# Altium schematic sheet USB & Power.SchDoc
size A; SheetNumber: 2; SheetTotal: 3
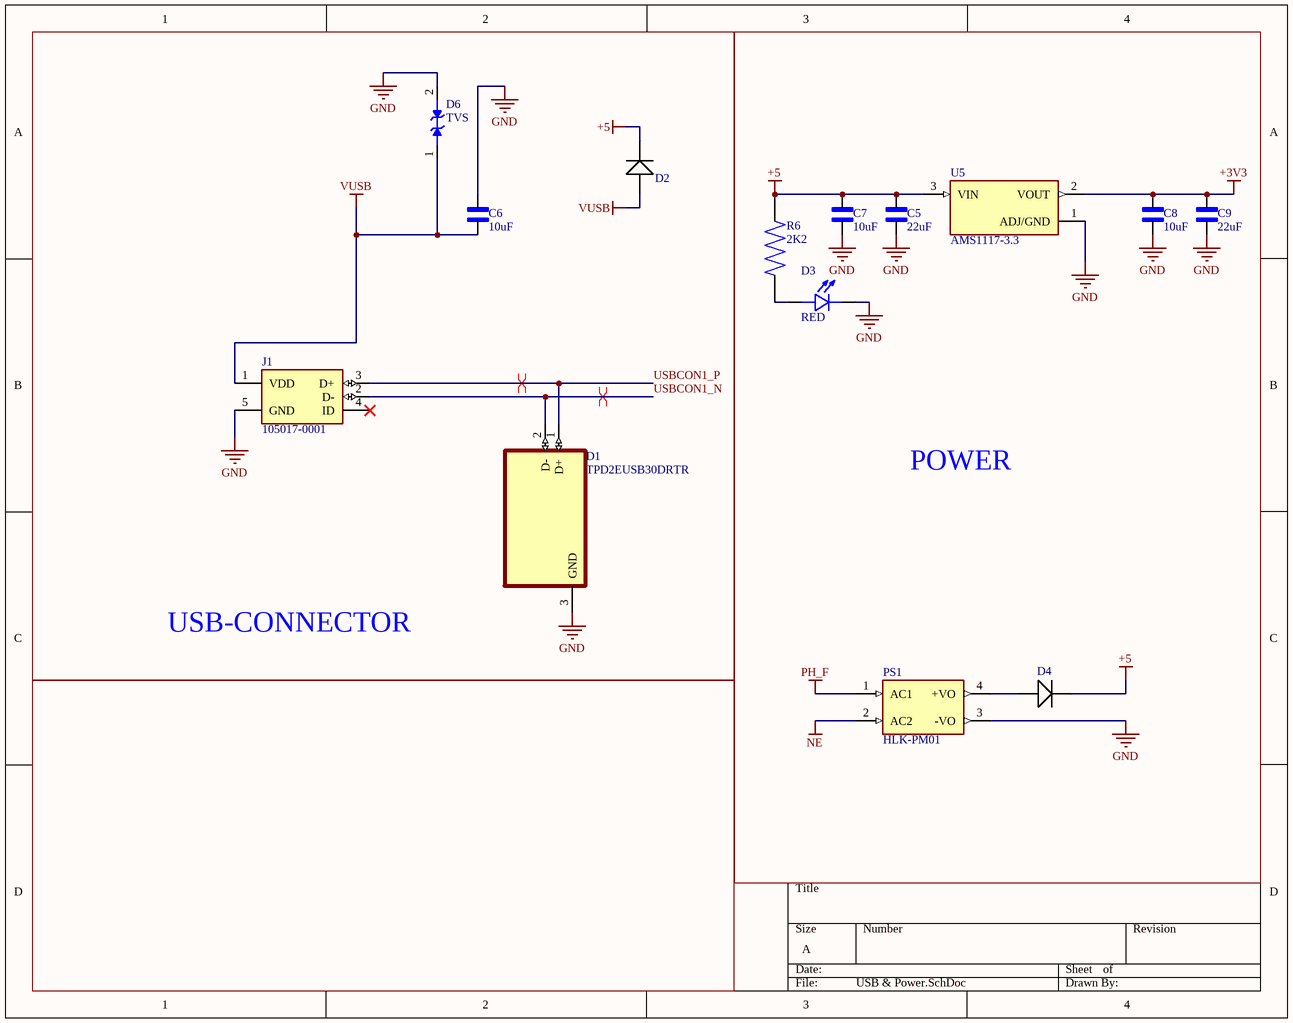
[diagram p0: USB & Power.SchDoc]

## Parts
C5  22uF  [CAPC1608X90]
C6  10uF  [CAPC1608X100N]
C7  10uF  [CAPC1608X100N]
C8  10uF  [CAPC1608X100N]
C9  22uF  [CAPC1608X90]
D1  TPD2EUSB30DRTR  [SOTFL35P100X50-3N]
D2  Panasonic DB2J20900L Schottky Diode, 0.5A, 20V, 2.4ns, 2-Pin SMini2 F5 B  [DIOM1712X07N]  (value not drawn)
D3  RED  [LED_APHHS1005LSECK/J3-PF]
D4  Panasonic DB2J20900L Schottky Diode, 0.5A, 20V, 2.4ns, 2-Pin SMini2 F5 B  [DIOM1712X07N]  (value not drawn)
D6  TVS  [DIO_TPD1E05U06DPYR]
J1  105017-0001  [MOLEX_105017-0001]
PS1  HLK-PM01  [CONV_HLK-PM01]
R6  2K2  [RESC1005X35N]
U5  AMS1117-3.3  [SOT229P700X180-4N]

## Blocks framed on the sheet
USB-CONNECTOR: C6 D1 D2 D6 J1
POWER: C5 C7-C9 D3 D4 PS1 R6 U5

## Nets
+3V3: C8.2 C9.1 U5.2(VOUT)
+5: C5.1 C7.2 D2.1 D4.1 R6.2 U5.3(VIN)
GND: C5.2 C6.2 C7.1 C8.1 C9.2 D1.3(GND) D3.1(C) D6.2(A1) J1.5(GND) PS1.3(-VO) U5.1(ADJ/GND)
NE: PS1.2(AC2)
PH_F: PS1.1(AC1)
VUSB: C6.1 D2.2 D6.1(A) J1.1(VDD)
USBCON1_N: D1.2(D-) J1.2(D-)
USBCON1_P: D1.1(D+) J1.3(D+)
NetD3_2: D3.2(A) R6.1
NetD4_2: D4.2 PS1.4(+VO)

Not connected (* = marked no-connect by the designer): J1 4(ID)*

## Layout directives
differential pair; differential pair class DIFF90: USBCON1_N, USBCON1_P

## Library data of the parts
C5 C9 = CC0603MRX5R6BB226: 22 ÂµF Â±20% 10V Ceramic Capacitor X5R 0603 (1608 Metric); MF: Yageo; SnapEDA_Link: https://www.snapeda.com/parts/CC0603MRX5R6BB226/Yageo/view-part/?ref=snap; Package: 0603 Yageo; Value: *; MP: CC0603MRX5R6BB226; Check_prices: https://www.snapeda.com/parts/CC0603MRX5R6BB226/Yageo/view-part/?ref=eda
C6-C8 = C1608X5R1E106M080AC: 10 ÂµF Â±20% 25V Ceramic Capacitor X5R 0603 (1608 Metric); MF: TDK Corporation; SnapEDA_Link: https://www.snapeda.com/parts/C1608X5R1E106M080AC/TDK/view-part/?ref=snap; Package: 1608-2 TDK; Value: *; MP: C1608X5R1E106M080AC; Check_prices: https://www.snapeda.com/parts/C1608X5R1E106M080AC/TDK/view-part/?ref=eda
D1 = TPD2EUSB30DRTR: 2-channel ESD solution for SuperSpeed USB 3.0 interface 3-SOT-9X3 -40 to 85; MF: Texas Instruments; Package: SOT-9X3-3 Texas Instruments; Purchase-URL: https://pricing.snapeda.com/search/part/TPD2EUSB30DRTR/?ref=eda; Value: *; MP: TPD2EUSB30DRTR; Availability: Warning; SnapEDA_Link: https://www.snapeda.com/parts/TPD2EUSB30DRTR/Texas%20Instruments/view-part/189118/?ref=snap; Price: None
D2 D4 = Schottky Diode, 0.5A, 20V, 2.4ns, 2-Pin SMini2 F5 B: Created By: R Kanjee; Date Created: 1 March 2015; Manufacturer: Panasonic; RS Stock No.: 713-2703; Manufacturer Part No.: DB2J20900L; Datasheet: http://docs-europe.electrocomponents.com/webdocs/1398/0900766b813986b3.pdf; Maximum Continuous Forward Current: 0.5A; Peak Reverse Repetitive Voltage: 20V
D3 = APHHS1005LSECK/J3-PF: Red 625nm LED Indication - Discrete 1.8V 0402 (1005 Metric); MF: Kingbright; SnapEDA_Link: https://www.snapeda.com/parts/APHHS1005LSECK/J3-PF/Kingbright/view-part/?ref=snap; Package: 0402 Kingbright Corporation; Value: *; MP: APHHS1005LSECK/J3-PF; Check_prices: https://www.snapeda.com/parts/APHHS1005LSECK/J3-PF/Kingbright/view-part/?ref=eda
D6 = TPD1E10B06DPYT: Single-channel ESD in 0402 package with 10pF capacitance and 6-V breakdown 2-X1SON -40 to 125; MF: Texas Instruments; Value: *; Package: X1SON-2 Texas Instruments; Purchase-URL: https://pricing.snapeda.com/search/part/TPD1E10B06DPYT/?ref=eda; SnapEDA_Link: https://www.snapeda.com/parts/TPD1E10B06DPYT/Texas%20Instruments/view-part/231963/?ref=snap; Digi-Key_Part_Number: 296-41842-1-ND; Check_prices: https://www.snapeda.com/parts/TPD1E10B06DPYT/Texas%20Instruments/view-part/231963/?ref=eda; MP: TPD1E10B06DPYT
J1 = 105017-0001: ÐŸÐ¾Ð´ÐºÐ».; Ð¿ÐµÑ€ÐµÐ´Ð°Ñ‡Ð° Ð´Ð°Ð½Ð½Ñ‹Ñ…; USB; Ð¿Ñ€Ð¸ÐµÐ¼; Micro; Ñ‚Ð¸Ð¿ B; Ð½Ð¸Ð¶Ð½ÐµÐµ ÐºÑ€ÐµÐ¿Ð»ÐµÐ½Ð¸Ðµ, SMT, Ñ Ð¿Ñ€Ð¸Ð¿Ð¾ÐµÐ¼, Ð±ÐµÐ· ÑÐ²Ð¸Ð½Ñ†Ð° ¦ Molex Incorporated 105017-0001; SnapEDA_Link: https://www.snapeda.com/parts/105017-0001/Molex/view-part/?ref=snap; Package: None; Value: *; MF: Molex; MP: 105017-0001; Check_prices: https://www.snapeda.com/parts/105017-0001/Molex/view-part/?ref=eda
PS1 = HLK-PM01: The HLK-PM01 is a small size low cost AC to DC converter which can take in 110V/220V AC at 50/60 Hz and give 5V 3W output. The module is can be used in designs which run on 5V and needs to be powered form the AC mains.; MF: Hi-link; SnapEDA_Link: https://www.snapeda.com/parts/hlk-pm01/Hi-link/view-part/?ref=snap; Package: None; Value: *; MP: hlk-pm01; Check_prices: https://www.snapeda.com/parts/hlk-pm01/Hi-link/view-part/?ref=eda
R6 = RT0402FRE075K1L: Res Thin Film 0402 2K2 Ohm 1% 0.063W(1/16W) Â±50ppm/C Molded SMD Paper T/R; MF: Yageo; SnapEDA_Link: https://www.snapeda.com/parts/RT0402FRE075K1L/Yageo/view-part/?ref=snap; Package: 1005 Yageo; Value: *; MP: RT0402FRE075K1L; Check_prices: https://www.snapeda.com/parts/RT0402FRE075K1L/Yageo/view-part/?ref=eda
U5 = AMS1117-3.3: Linear Voltage Regulator IC Positive Fixed 1 Output 1A SOT-223-3L; MF: UMW; SnapEDA_Link: https://www.snapeda.com/parts/AMS1117-3.3/UMW/view-part/?ref=snap; Package: SOT-223-3L UMW; Value: *; MP: AMS1117-3.3; Check_prices: https://www.snapeda.com/parts/AMS1117-3.3/UMW/view-part/?ref=eda